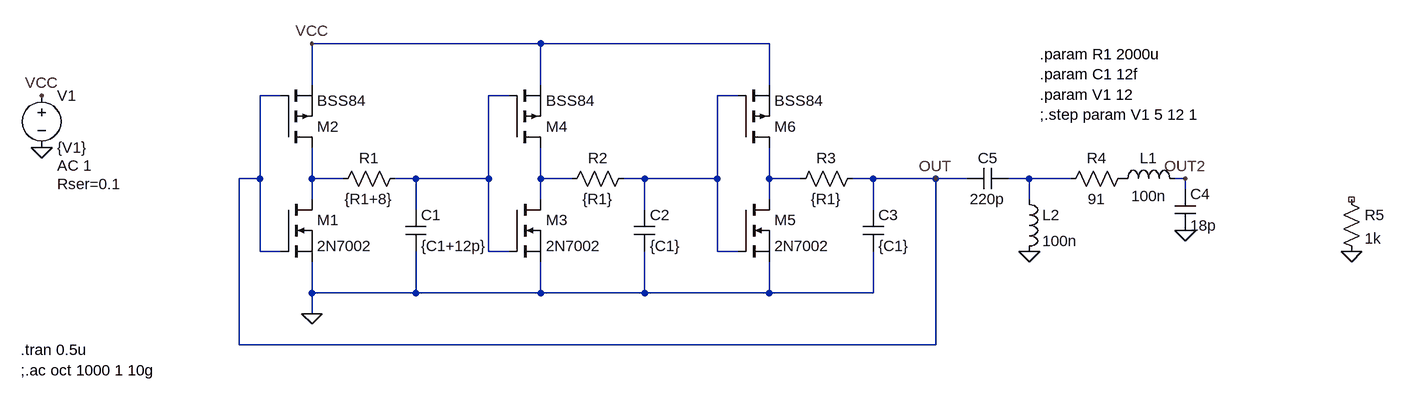
[diagram p0: schematic oscillator_mosfets.asc]
oscillator_mosfets.asc, the LTspice schematic file:
Version 4
SHEET 1 1752 680
WIRE 448 -128 96 -128
WIRE 800 -128 448 -128
WIRE 96 -64 96 -128
WIRE 448 -64 448 -128
WIRE 800 -64 800 -128
WIRE 48 -48 16 -48
WIRE 400 -48 368 -48
WIRE 752 -48 720 -48
WIRE 16 80 16 -48
WIRE 16 80 -16 80
WIRE 96 80 96 32
WIRE 144 80 96 80
WIRE 256 80 224 80
WIRE 368 80 368 -48
WIRE 368 80 256 80
WIRE 448 80 448 32
WIRE 496 80 448 80
WIRE 608 80 576 80
WIRE 720 80 720 -48
WIRE 720 80 608 80
WIRE 800 80 800 32
WIRE 848 80 800 80
WIRE 960 80 928 80
WIRE 1056 80 960 80
WIRE 1104 80 1056 80
WIRE 1200 80 1168 80
WIRE 1264 80 1200 80
WIRE 1440 80 1424 80
WIRE 1440 96 1440 80
WIRE 96 112 96 80
WIRE 448 112 448 80
WIRE 800 112 800 80
WIRE 1200 112 1200 80
WIRE 256 128 256 80
WIRE 608 128 608 80
WIRE 960 128 960 80
WIRE 16 192 16 80
WIRE 48 192 16 192
WIRE 368 192 368 80
WIRE 400 192 368 192
WIRE 720 192 720 80
WIRE 752 192 720 192
WIRE 96 256 96 208
WIRE 256 256 256 192
WIRE 256 256 96 256
WIRE 448 256 448 208
WIRE 448 256 256 256
WIRE 608 256 608 192
WIRE 608 256 448 256
WIRE 800 256 800 208
WIRE 800 256 608 256
WIRE 960 256 960 192
WIRE 960 256 800 256
WIRE 96 288 96 256
WIRE -16 336 -16 80
WIRE 1056 336 1056 80
WIRE 1056 336 -16 336
FLAG -320 32 0
FLAG -320 -48 VCC
FLAG 96 -128 VCC
FLAG 96 288 0
FLAG 1056 80 OUT
FLAG 1440 160 0
FLAG 1440 80 OUT2
FLAG 1696 192 0
FLAG 1200 192 0
SYMBOL nmos 48 112 R0
SYMATTR InstName M1
SYMATTR Value 2N7002
SYMBOL pmos 48 32 M180
SYMATTR InstName M2
SYMATTR Value BSS84
SYMBOL res 240 64 R90
WINDOW 0 0 56 VBottom 2
WINDOW 3 32 56 VTop 2
SYMATTR InstName R1
SYMATTR Value {R1+8}
SYMBOL cap 240 128 R0
SYMATTR InstName C1
SYMATTR Value {C1+12p}
SYMBOL voltage -320 -64 R0
WINDOW 123 24 124 Left 2
WINDOW 39 24 152 Left 2
SYMATTR Value2 AC 1
SYMATTR SpiceLine Rser=0.1
SYMATTR InstName V1
SYMATTR Value {V1}
SYMBOL nmos 400 112 R0
SYMATTR InstName M3
SYMATTR Value 2N7002
SYMBOL pmos 400 32 M180
SYMATTR InstName M4
SYMATTR Value BSS84
SYMBOL res 592 64 R90
WINDOW 0 0 56 VBottom 2
WINDOW 3 32 56 VTop 2
SYMATTR InstName R2
SYMATTR Value {R1}
SYMBOL cap 592 128 R0
SYMATTR InstName C2
SYMATTR Value {C1}
SYMBOL nmos 752 112 R0
SYMATTR InstName M5
SYMATTR Value 2N7002
SYMBOL pmos 752 32 M180
SYMATTR InstName M6
SYMATTR Value BSS84
SYMBOL res 944 64 R90
WINDOW 0 0 56 VBottom 2
WINDOW 3 32 56 VTop 2
SYMATTR InstName R3
SYMATTR Value {R1}
SYMBOL cap 944 128 R0
SYMATTR InstName C3
SYMATTR Value {C1}
SYMBOL ind 1328 96 R270
WINDOW 0 32 56 VTop 2
WINDOW 3 5 56 VBottom 2
SYMATTR InstName L1
SYMATTR Value 100n
SYMBOL cap 1424 96 R0
SYMATTR InstName C4
SYMATTR Value 18p
SYMBOL cap 1168 64 R90
WINDOW 0 0 32 VBottom 2
WINDOW 3 32 32 VTop 2
SYMATTR InstName C5
SYMATTR Value 220p
SYMBOL res 1360 64 R90
WINDOW 0 0 56 VBottom 2
WINDOW 3 32 56 VTop 2
SYMATTR InstName R4
SYMATTR Value 91
SYMBOL res 1680 96 R0
SYMATTR InstName R5
SYMATTR Value 1k
SYMBOL ind 1184 96 R0
SYMATTR InstName L2
SYMATTR Value 100n
SYMATTR SpiceLine Rser=100
TEXT 1216 -112 Left 2 !.param R1 2000u\n.param C1 12f\n.param V1 12\n;.step param V1 5 12 1
TEXT -352 344 Left 2 !.tran 0.5u\n;.ac oct 1000 1 10g

The netlist it stands for:
* oscillator_mosfets.asc
M1 N003 OUT 0 0 2N7002
M2 N003 OUT VCC VCC BSS84
R1 N001 N003 {R1+8}
C1 N001 0 {C1+12p}
V1 VCC 0 {V1} AC 1 Rser=0.1
M3 N004 N001 0 0 2N7002
M4 N004 N001 VCC VCC BSS84
R2 N002 N004 {R1}
C2 N002 0 {C1}
M5 N005 N002 0 0 2N7002
M6 N005 N002 VCC VCC BSS84
R3 OUT N005 {R1}
C3 OUT 0 {C1}
L1 P001 OUT2 100n
C4 OUT2 0 18p
C5 N006 OUT 220p
R4 P001 N006 91
R5 NC_01 0 1k
L2 N006 0 100n Rser=100
.model NMOS NMOS
.model PMOS PMOS
.lib standard.mos
.param R1 2000u
.param C1 12f
.param V1 12
;.step param V1 5 12 1
.tran 0.5u
;.ac oct 1000 1 10g
.backanno
.end